# Altium schematic sheet RelaySheet-v1.1.SchDoc
size 420 x 297 mm; SheetNumber: 3; SheetTotal: 3
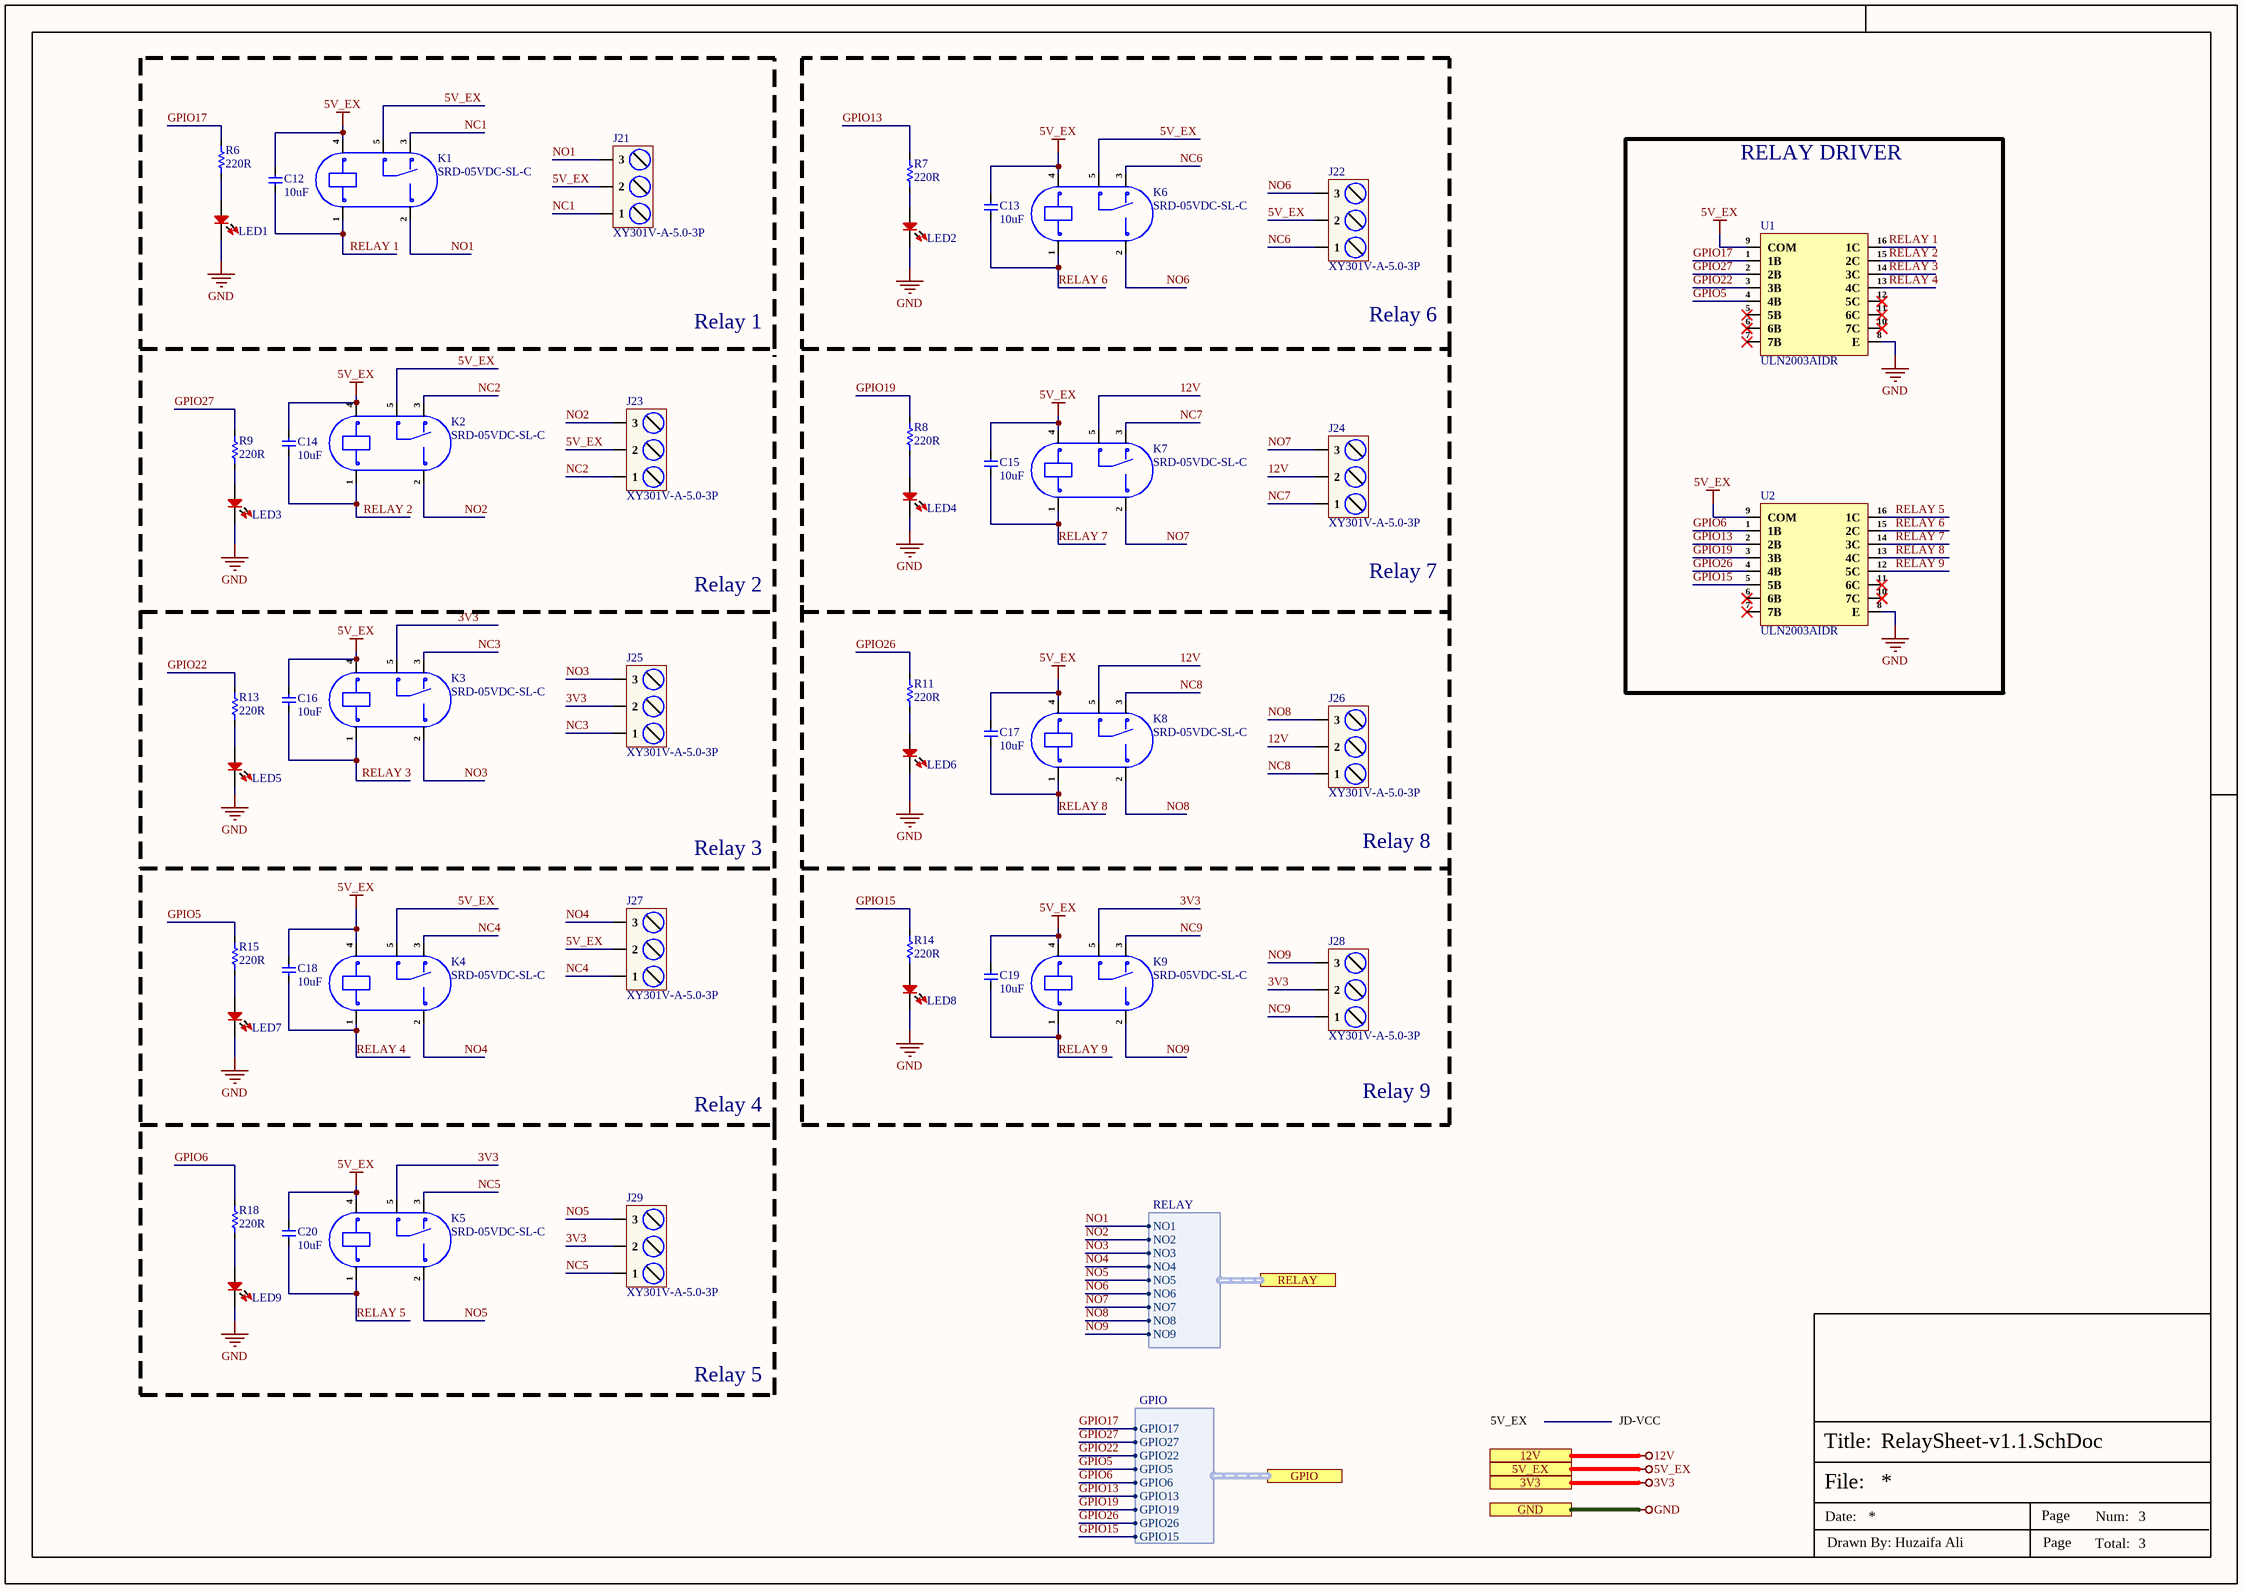
[diagram p0: RelaySheet-v1.1.SchDoc]

## Parts
C12  10uF  [Cap-0805]
C13  10uF  [Cap-0805]
C14  10uF  [Cap-0805]
C15  10uF  [Cap-0805]
C16  10uF  [Cap-0805]
C17  10uF  [Cap-0805]
C18  10uF  [Cap-0805]
C19  10uF  [Cap-0805]
C20  10uF  [Cap-0805]
J21  XY301V-A-5.0-3P  [XY301V-A-5.0-3P]
J22  XY301V-A-5.0-3P  [XY301V-A-5.0-3P]
J23  XY301V-A-5.0-3P  [XY301V-A-5.0-3P]
J24  XY301V-A-5.0-3P  [XY301V-A-5.0-3P]
J25  XY301V-A-5.0-3P  [XY301V-A-5.0-3P]
J26  XY301V-A-5.0-3P  [XY301V-A-5.0-3P]
J27  XY301V-A-5.0-3P  [XY301V-A-5.0-3P]
J28  XY301V-A-5.0-3P  [XY301V-A-5.0-3P]
J29  XY301V-A-5.0-3P  [XY301V-A-5.0-3P]
K1  SRD-05VDC-SL-C  [SRD-05VDC-SL-C]
K2  SRD-05VDC-SL-C  [SRD-05VDC-SL-C]
K3  SRD-05VDC-SL-C  [SRD-05VDC-SL-C]
K4  SRD-05VDC-SL-C  [SRD-05VDC-SL-C]
K5  SRD-05VDC-SL-C  [SRD-05VDC-SL-C]
K6  SRD-05VDC-SL-C  [SRD-05VDC-SL-C]
K7  SRD-05VDC-SL-C  [SRD-05VDC-SL-C]
K8  SRD-05VDC-SL-C  [SRD-05VDC-SL-C]
K9  SRD-05VDC-SL-C  [SRD-05VDC-SL-C]
LED1  LTST-C193KRKT-5A  [LED-0603]  (value not drawn)
LED2  LTST-C193KRKT-5A  [LED-0603]  (value not drawn)
LED3  LTST-C193KRKT-5A  [LED-0603]  (value not drawn)
LED4  LTST-C193KRKT-5A  [LED-0603]  (value not drawn)
LED5  LTST-C193KRKT-5A  [LED-0603]  (value not drawn)
LED6  LTST-C193KRKT-5A  [LED-0603]  (value not drawn)
LED7  LTST-C193KRKT-5A  [LED-0603]  (value not drawn)
LED8  LTST-C193KRKT-5A  [LED-0603]  (value not drawn)
LED9  LTST-C193KRKT-5A  [LED-0603]  (value not drawn)
R6  220R  [Res-0603]
R7  220R  [Res-0603]
R8  220R  [Res-0603]
R9  220R  [Res-0603]
R11  220R  [Res-0603]
R13  220R  [Res-0603]
R14  220R  [Res-0603]
R15  220R  [Res-0603]
R18  220R  [Res-0603]
U1  ULN2003AIDR  [16-SOIC (0.154", 3.90mm Width)]
U2  ULN2003AIDR  [16-SOIC (0.154", 3.90mm Width)]

## Blocks framed on the sheet
Relay 1: C12 J21 K1 LED1 R6
Relay 6: C13 J22 K6 LED2 R7
RELAY DRIVER: U1 U2

## Ports
3V3 (see Top-Sheet[3B], ConnectorSheet-v1.1[4D]), 5V_EX (see Top-Sheet[3B], ConnectorSheet-v1.1[4D]), 12V (see Top-Sheet[3B], ConnectorSheet-v1.1[4D]), GND (see Top-Sheet[3B], ConnectorSheet-v1.1[4D]), GPIO (harness GPIO, see Top-Sheet[3B], ConnectorSheet-v1.1[4D]), RELAY (harness RELAY, see Top-Sheet[3B], ConnectorSheet-v1.1[3D])

## Harnesses
GPIO: GPIO17, GPIO27, GPIO22, GPIO5, GPIO6, GPIO13, GPIO19, GPIO26, GPIO15
RELAY: NO2, NO1, NO3, NO4, NO5, NO6, NO7, NO8, NO9

## Nets
3V3: J25.2 J28.2 J29.2 K3.5 K5.5 K9.5 ; port 3V3
5V_EX: C12.2 C13.2 C14.2 C15.2 C16.2 C17.2 C18.2 C19.2 C20.2 J21.2 J22.2 J23.2 J27.2 K1.4 K1.5 K2.4 K2.5 K3.4 K4.4 K4.5 K5.4 K6.4 K6.5 K7.4 K8.4 K9.4 U1.9(COM) U2.9(COM) ; port 5V_EX
12V: J24.2 J26.2 K7.5 K8.5 ; port 12V
GND: LED1.2 LED2.2 LED3.2 LED4.2 LED5.2 LED6.2 LED7.2 LED8.2 LED9.2 U1.8(E) U2.8(E) ; port GND
GPIO5: R15.2 U1.4(4B) ; port GPIO.GPIO5
GPIO6: R18.2 U2.1(1B) ; port GPIO.GPIO6
GPIO13: R7.2 U2.2(2B) ; port GPIO.GPIO13
GPIO15: R14.2 U2.5(5B) ; port GPIO.GPIO15
GPIO17: R6.2 U1.1(1B) ; port GPIO.GPIO17
GPIO19: R8.2 U2.3(3B) ; port GPIO.GPIO19
GPIO22: R13.2 U1.3(3B) ; port GPIO.GPIO22
GPIO26: R11.2 U2.4(4B) ; port GPIO.GPIO26
GPIO27: R9.2 U1.2(2B) ; port GPIO.GPIO27
NC1: J21.1 K1.3
NC2: J23.1 K2.3
NC3: J25.1 K3.3
NC4: J27.1 K4.3
NC5: J29.1 K5.3
NC6: J22.1 K6.3
NC7: J24.1 K7.3
NC8: J26.1 K8.3
NC9: J28.1 K9.3
NO1: J21.3 K1.2 ; port RELAY.NO1
NO2: J23.3 K2.2 ; port RELAY.NO2
NO3: J25.3 K3.2 ; port RELAY.NO3
NO4: J27.3 K4.2 ; port RELAY.NO4
NO5: J29.3 K5.2 ; port RELAY.NO5
NO6: J22.3 K6.2 ; port RELAY.NO6
NO7: J24.3 K7.2 ; port RELAY.NO7
NO8: J26.3 K8.2 ; port RELAY.NO8
NO9: J28.3 K9.2 ; port RELAY.NO9
RELAY 1: C12.1 K1.1 U1.16(1C)
RELAY 2: C14.1 K2.1 U1.15(2C)
RELAY 3: C16.1 K3.1 U1.14(3C)
RELAY 4: C18.1 K4.1 U1.13(4C)
RELAY 5: C20.1 K5.1 U2.16(1C)
RELAY 6: C13.1 K6.1 U2.15(2C)
RELAY 7: C15.1 K7.1 U2.14(3C)
RELAY 8: C17.1 K8.1 U2.13(4C)
RELAY 9: C19.1 K9.1 U2.12(5C)
NetLED1_1: LED1.1 R6.1
NetLED2_1: LED2.1 R7.1
NetLED3_1: LED3.1 R9.1
NetLED4_1: LED4.1 R8.1
NetLED5_1: LED5.1 R13.1
NetLED6_1: LED6.1 R11.1
NetLED7_1: LED7.1 R15.1
NetLED8_1: LED8.1 R14.1
NetLED9_1: LED9.1 R18.1

Not connected (* = marked no-connect by the designer): U1 5(5B)* 6(6B)* 7(7B)* 10(7C)* 11(6C)* 12(5C)*; U2 6(6B)* 7(7B)* 10(7C)* 11(6C)*

## Notes on the sheet
- Relay 2
- Relay 7
- Relay 3
- Relay 8
- Relay 4
- Relay 9
- Relay 5
- 5V_EX
- JD-VCC
- File:
- Title:
- Date:
- Page
- Num:
- Total:
- Drawn By: Huzaifa Ali

## Library data of the parts
C12-C20 = GRM21BR61H106ME43L: CAP CER 10UF 50V X5R 0805; Manufacturer: Murata; Supplier 1: Digi-Key; Manufacturer Part Number: GRM21BR61H106ME43L; RoHS: Yes; Category: Ceramic Capacitors; Stock 1: 26; Pricing 1: 1=0.44000, 10=0.30700, 50=0.21500, 100=0.18420, 500=0.13818, 1000=0.11668 (USD); Supplier Part Number 1: 490-18664-1-ND; LCSC Part Number: C2190942
J21-J29 = XY301V-A-5.0-3P: 1x3P 15A 300V Blue 14~22 Straight 5mm 1.5 1 3 Plugin,P=5mm Screw terminal ROHS; Manufacturer: Ningbo Xinlaiya Elec; Manufacturer Part Number: XY301V-A-5.0-3P; Package: Plugin,P=5mm; LCSC Part Number: C557652; Item Type: Screw terminal; ComponentLink1Description: LCSC; ComponentLink1URL: https://www.lcsc.com/product-detail/Screw-terminal_Ningbo-Xinlaiya-Elec-XY301V-A-5-0-3P_C557652.html
K1-K9 = SRD-05VDC-SL-C: 250V@AC 5V 15A SPDT (1 Form C) Plugin,15.6x19.2mm Power Relays ROHS; Manufacturer: Ningbo Songle Relay; Manufacturer Part Number: SRD-05VDC-SL-C; Package: Plugin,15.6x19.2mm; LCSC Part Number: C35449; Item Type: Relays; ComponentLink1Description: LCSC; ComponentLink1URL: https://www.lcsc.com/product-detail/Power-Relays_Ningbo-Songle-Relay-SRD-05VDC-SL-C_C35449.html
LED1-LED9 = LTST-C193KRKT-5A: LED RED CLEAR CHIP SMD; Manufacturer: Vishay Lite-On; Item Type: LEDs; Lens Color: Colorless; Viewing Angle: 130°; Lens Style: Flat,Diffused,Colorless,Rectangular,Clear; Luminous Intensity: 45mcd; Forward Current: 30mA; Forward Voltage: 2.3V; Test Current: 5mA; Dominant Wavelength: 631nm; Number of Elements: 1; Power Dissipation: 75mW; Reverse Voltage: 5V; Lens Size: 0.8mm; Supplier: Digikey; Supplier Part Number: 160-1830-1-ND; Manufacturer Part Number: LTST-C193KRKT-5A; RoHS: Yes; Stock: 241564; Pricing: 1=0.39, 10=0.211, 100=0.0981, 500=0.0906, 1000=0.07097, 2000=0.06946 (USD); Mounting Technology: Surface Mount; Case/Package: 0603; Pins: 2; Color: Red; Case Code (Metric): 1608; Case Code (Imperial): 0603; Min Operating Temperature: -55°C; Max Operating Temperature: 85°C; Package Quantity: 3000; Packaging: Tape and Reel; Illumination Color: Red; Lens Transparency: Clear; Number of LEDs: 1; Series: -; Wavelength: 631nm; Length: 1.6mm; Width: 0.8mm; Height: 0.45mm; Depth: 0.8mm; Radiation Hardening: No; Lead Free: Lead Free; RoHS Compliant: Yes; ComponentLink1URL: https://datasheet.ciiva.com/11775/0900766b80dc0551-11775612.pdf?src-supplier=Rs; ComponentLink1Description: https://datasheet.ciiva.com/11775/0900766b80dc0551-11775612.pdf?src-supplier=Rs; ComponentLink2URL: https://datasheet.ciiva.com/4689/100-ltst-c193krkt-5a-61179-4689123.pdf?src-supplier=Mouser; ComponentLink2Description: https://datasheet.ciiva.com/4689/100-ltst-c193krkt-5a-61179-4689123.pdf?src-supplier=Mouser; ComponentLink3URL: https://datasheet.ciiva.com/16210/ltst-c193krkt-5a-16210822.pdf?src-supplier=Future+Electronics; ComponentLink3Description: https://datasheet.ciiva.com/16210/ltst-c193krkt-5a-16210822.pdf?src-supplier=Future+Electronics; ComponentLink4URL: https://datasheet.ciiva.com/2110/s-110-ltst-c193krkt-5a-2110272.pdf?src-supplier=Digikey; ComponentLink4Description: https://datasheet.ciiva.com/2110/s-110-ltst-c193krkt-5a-2110272.pdf?src-supplier=Digikey
R6-R9 R11 R13-R15 R18 = CRCW0603220RFKEA: RES SMD 220 OHM 1% 1/10W 0603; Item Type: Resistor; Temperature Coefficient: 100ppm/°C; Max Power Dissipation: 100mW; Voltage Rating (DC): 75V; LCSC Part Number: C844757; ComponentLink1Description: LCSC; Supplier: Mouser; Supplier Part Number: 71-CRCW0603-220-E3; RoHS: Yes; Category: Chip SMD Resistors; Stock: 40706; Pricing: 1=0.1, 10=0.017, 50=0.017, 100=0.01, 1000=0.008, 10000=0.004 (USD); Case/Package: 0603; Contact Plating: Tin; Case Code (Metric): 1608; Case Code (Imperial): 0603; Weight: 7.1E-05oz; Min Operating Temperature: -55°C; Max Operating Temperature: 155°C; Value: 220R; Tolerance: 1%; Packaging: Tape and Reel; Series: CRCW; Resistor Type: Thick Film; Number of Terminations: 2; Termination: SMD/SMT; Power Rating: 100mW; Voltage Rating: 75V; Package Quantity: 5000; Features: Automotive AEC-Q200; Resistance Tolerance: 1%; Technology: THICK FILM; Construction: Rectangular; Length: 1.55mm; Width: 0.85mm; Height: 0.45mm; Depth: 0.85mm; Ratings: AEC-Q200; Radiation Hardening: No; RoHS Compliant: Yes; Lead Free: Lead Free; Reach SVHC Compliant: Unknown; Military Standard: Not; ComponentLink2URL: https://datasheet.ciiva.com/11810/0900766b80d98afc-11810631.pdf?src-supplier=Rs; ComponentLink2Description: https://datasheet.ciiva.com/11810/0900766b80d98afc-11810631.pdf?src-supplier=Rs; ComponentLink3URL: https://datasheet.ciiva.com/8339/dcrcwe3-8339957.pdf?src-supplier=Avnet; ComponentLink3Description: https://datasheet.ciiva.com/8339/dcrcwe3-8339957.pdf?src-supplier=Avnet; ComponentLink4URL: https://datasheet.ciiva.com/16222/dcrcwe3-16222278.pdf?src-supplier=Future+Electronics; ComponentLink4Description: https://datasheet.ciiva.com/16222/dcrcwe3-16222278.pdf?src-supplier=Future+Electronics; ComponentLink5URL: https://datasheet.ciiva.com/7777/1697337-7777301.pdf?src-supplier=Element14; ComponentLink5Description: https://datasheet.ciiva.com/7777/1697337-7777301.pdf?src-supplier=Element14; ComponentLink6URL: https://datasheet.ciiva.com/16763/70201119-16763287.pdf?src-supplier=Allied+Electronics; ComponentLink6Description: https://datasheet.ciiva.com/16763/70201119-16763287.pdf?src-supplier=Allied+Electronics; ComponentLink7URL: https://datasheet.ciiva.com/2466/dcrcwe3-2466464.pdf?src-supplier=Digi-Key; ComponentLink7Description: https://datasheet.ciiva.com/2466/dcrcwe3-2466464.pdf?src-supplier=Digi-Key; ComponentLink8URL: https://datasheet.ciiva.com/2466/dcrcwe3-2466465.pdf?src-supplier=Digi-Key; ComponentLink8Description: https://datasheet.ciiva.com/2466/dcrcwe3-2466465.pdf?src-supplier=Digi-Key; ComponentLink9URL: https://datasheet.ciiva.com/2466/dcrcwe3-2466466.pdf?src-supplier=Digi-Key; ComponentLink9Description: https://datasheet.ciiva.com/2466/dcrcwe3-2466466.pdf?src-supplier=Digi-Key; ComponentLink10URL: https://datasheet.ciiva.com/7777/1720486-7777551.pdf?src-supplier=Element14; ComponentLink10Description: https://datasheet.ciiva.com/7777/1720486-7777551.pdf?src-supplier=Element14; ComponentLink11URL: https://datasheet.ciiva.com/26316/fld-crcw-e3-data-en-26316574.pdf?src-supplier=Distrelec; ComponentLink11Description: https://datasheet.ciiva.com/26316/fld-crcw-e3-data-en-26316574.pdf?src-supplier=Distrelec; ComponentLink12URL: https://datasheet.ciiva.com/5550/dcrcwe3-109170-5550773.pdf?src-supplier=Mouser; ComponentLink12Description: https://datasheet.ciiva.com/5550/dcrcwe3-109170-5550773.pdf?src-supplier=Mouser; ComponentLink13URL: https://datasheet.ciiva.com/15159/getdatasheetpartid-45816-15159565.pdf?src-supplier=Verical; ComponentLink13Description: https://datasheet.ciiva.com/15159/getdatasheetpartid-45816-15159565.pdf?src-supplier=Verical
U1 U2 = ULN2003AIDR: IC PWR RELAY 7NPN 1:1 16SOIC; Manufacturer: Texas Instruments; Supplier: Mouser; Supplier Part Number: 595-ULN2003AIDR; Manufacturer Part Number: ULN2003AIDR; RoHS: Yes; Item Type: IC; Stock: 2012; Pricing: 1=0.66, 10=0.589, 50=0.589, 100=0.402, 1000=0.285, 10000=0.232 (USD); ComponentLink1URL: https://datasheet.ciiva.com/15139/getdatasheetpartid-47948-15139878.pdf?src-supplier=Verical; ComponentLink1Description: https://datasheet.ciiva.com/15139/getdatasheetpartid-47948-15139878.pdf?src-supplier=Verical; ComponentLink2URL: https://datasheet.ciiva.com/14424/ulq2003a-14424030.pdf?src-supplier=Avnet; ComponentLink2Description: https://datasheet.ciiva.com/14424/ulq2003a-14424030.pdf?src-supplier=Avnet; ComponentLink3URL: https://datasheet.ciiva.com/1700/uln2003ai-1700820.pdf?src-supplier=Digikey; ComponentLink3Description: https://datasheet.ciiva.com/1700/uln2003ai-1700820.pdf?src-supplier=Digikey; ComponentLink4URL: https://datasheet.ciiva.com/1700/uln2003ai-1700821.pdf?src-supplier=Digikey; ComponentLink4Description: https://datasheet.ciiva.com/1700/uln2003ai-1700821.pdf?src-supplier=Digikey; ComponentLink5URL: https://datasheet.ciiva.com/1700/uln2003ai-1700822.pdf?src-supplier=Digikey; ComponentLink5Description: https://datasheet.ciiva.com/1700/uln2003ai-1700822.pdf?src-supplier=Digikey